# Altium schematic sheet Darlington_Drivers.SchDoc
size A; SheetNumber: 5; SheetTotal: 6
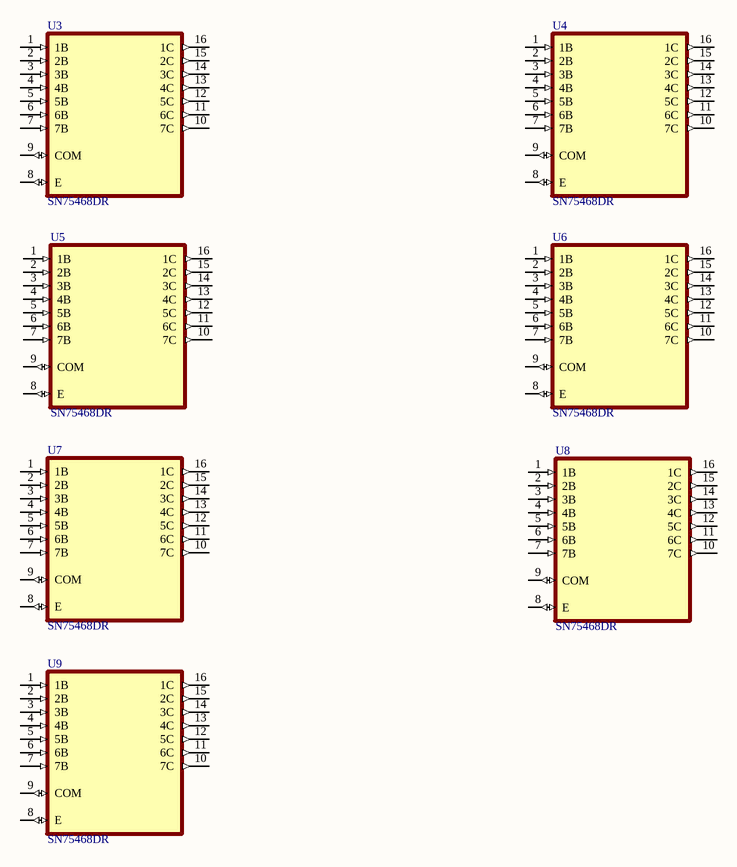
[diagram p0: Darlington_Drivers.SchDoc]

## Parts
U3  SN75468DR  [SOIC127P600X175-16N]
U4  SN75468DR  [SOIC127P600X175-16N]
U5  SN75468DR  [SOIC127P600X175-16N]
U6  SN75468DR  [SOIC127P600X175-16N]
U7  SN75468DR  [SOIC127P600X175-16N]
U8  SN75468DR  [SOIC127P600X175-16N]
U9  SN75468DR  [SOIC127P600X175-16N]

## Nets

Not connected (* = marked no-connect by the designer): U3 1(1B) 2(2B) 3(3B) 4(4B) 5(5B) 6(6B) 7(7B) 8(E) 9(COM) 10(7C) 11(6C) 12(5C) 13(4C) 14(3C) 15(2C) 16(1C); U4 1(1B) 2(2B) 3(3B) 4(4B) 5(5B) 6(6B) 7(7B) 8(E) 9(COM) 10(7C) 11(6C) 12(5C) 13(4C) 14(3C) 15(2C) 16(1C); U5 1(1B) 2(2B) 3(3B) 4(4B) 5(5B) 6(6B) 7(7B) 8(E) 9(COM) 10(7C) 11(6C) 12(5C) 13(4C) 14(3C) 15(2C) 16(1C); U6 1(1B) 2(2B) 3(3B) 4(4B) 5(5B) 6(6B) 7(7B) 8(E) 9(COM) 10(7C) 11(6C) 12(5C) 13(4C) 14(3C) 15(2C) 16(1C); U7 1(1B) 2(2B) 3(3B) 4(4B) 5(5B) 6(6B) 7(7B) 8(E) 9(COM) 10(7C) 11(6C) 12(5C) 13(4C) 14(3C) 15(2C) 16(1C); U8 1(1B) 2(2B) 3(3B) 4(4B) 5(5B) 6(6B) 7(7B) 8(E) 9(COM) 10(7C) 11(6C) 12(5C) 13(4C) 14(3C) 15(2C) 16(1C); U9 1(1B) 2(2B) 3(3B) 4(4B) 5(5B) 6(6B) 7(7B) 8(E) 9(COM) 10(7C) 11(6C) 12(5C) 13(4C) 14(3C) 15(2C) 16(1C)

## Library data of the parts
U3-U9 = CMP-00000-1: 100-V, 7-ch darlington array with TTL or CMOS compatibility; MF: Texas Instruments; Check_prices: https://www.snapeda.com/parts/SN75468DR/Texas+Instruments/view-part/?ref=eda; Price: None; Design Item ID: SN75468DR; MP: SN75468DR; SnapEDA_Link: https://www.snapeda.com/parts/SN75468DR/Texas+Instruments/view-part/?ref=snap; Value: *; Purchase-URL: https://pricing.snapeda.com/search/part/SN75468DR/?ref=eda; Package: SOIC-16 Texas Instruments; Availability: In Stock; Component Type: Standard; Source: SN75468DR.SchLib; Pin Count: 16